# EAGLE design source_eagle (EAGLE 9.6.2)
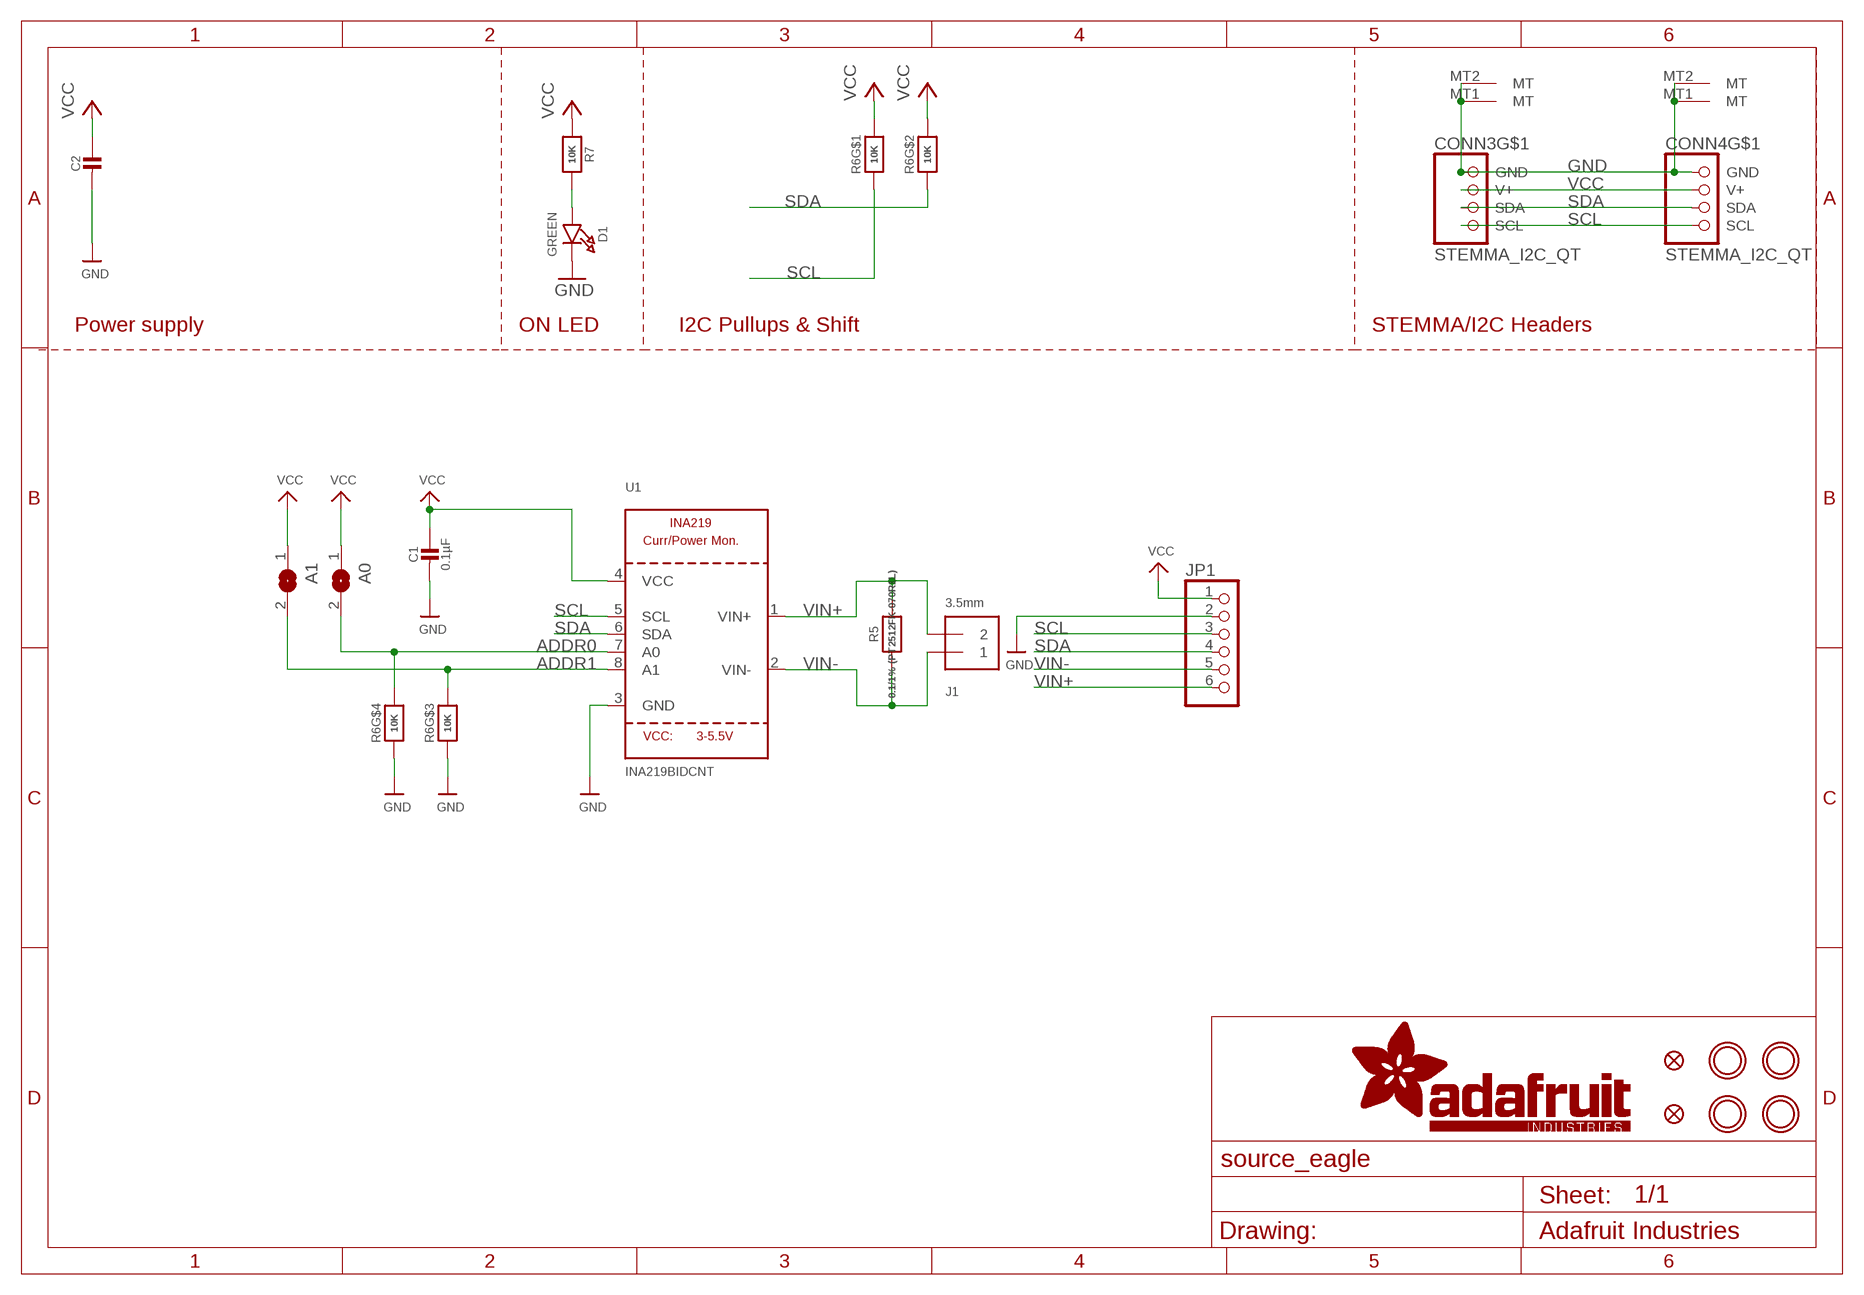
[diagram p0: schematic, sheet 1]

## Parts
A0  SOLDERJUMPERREFLOW_NOPASTE  [SOLDERJUMPER_REFLOW_NOPASTE]
A1  SOLDERJUMPERREFLOW_NOPASTE  [SOLDERJUMPER_REFLOW_NOPASTE]
C1  0.1µF  CAP_CERAMIC0603_NO  [0603-NO]
C2  10uF  CAP_CERAMIC0805-NOOUTLINE  [0805-NO]
CONN3  STEMMA_I2C_QT  [JST_SH4]
CONN4  STEMMA_I2C_QT  [JST_SH4]
D1  GREEN  LED0603_NOOUTLINE  [CHIPLED_0603_NOOUTLINE]
FID3  FIDUCIAL_1MM  [FIDUCIAL_1MM]
FID4  FIDUCIAL_1MM  [FIDUCIAL_1MM]
J1  3.5mm  TERMBLOCK_1X2_3.5MM  [TERMBLOCK_1X2-3.5MM]
JP1  HEADER-1X670MIL  [1X06_ROUND_70]
R5  0.1/1% (PT2512FK-070R1L)  RESISTOR2512  [2512]
R6  10K  RESISTOR_4PACK  [RESPACK_4X0603]
R7  10K  RESISTOR_0603_NOOUT  [0603-NO]
U1  INA219BIDCNT  INA219  [SOT23-8]
U$20  MOUNTINGHOLE2.5  [MOUNTINGHOLE_2.5_PLATED]
U$21  MOUNTINGHOLE2.5  [MOUNTINGHOLE_2.5_PLATED]
U$25  MOUNTINGHOLE2.5  [MOUNTINGHOLE_2.5_PLATED]
U$27  MOUNTINGHOLE2.5  [MOUNTINGHOLE_2.5_PLATED]

## Nets
ADDR0: A0.2 R6.5 U1.7(A0)
ADDR1: A1.2 R6.6 U1.8(A1)
GND: C1.2 C2.2 CONN3.1(GND) CONN3.MT1(MT) CONN3.MT2(MT) CONN4.1(GND) CONN4.MT1(MT) CONN4.MT2(MT) D1.C JP1.2 R6.3 R6.4 U1.3(GND)
N$3: D1.A R7.2
SCL: CONN3.4(SCL) CONN4.4(SCL) JP1.3 R6.1 U1.5(SCL)
SDA: CONN3.3(SDA) CONN4.3(SDA) JP1.4 R6.2 U1.6(SDA)
VCC: A0.1 A1.1 C1.1 C2.1 CONN3.2(V+) CONN4.2(V+) JP1.1 R6.7 R6.8 R7.1 U1.4(VCC)
VIN+: J1.2 JP1.6 R5.2 U1.1(VIN+)
VIN-: J1.1 JP1.5 R5.1 U1.2(VIN-)

## Notes on the sheet
- Power supply | ON LED | I2C Pullups & Shift | STEMMA/I2C Headers

## Library data of the parts
A0 A1 = microbuilder:SOLDERJUMPER: SMD Solder JUMPER Solder the two pads together to create a connection, or remove the solder to break it. REFLOW - Use this footprint for solder paste and reflow ovens. WAVE - Use this footprint for hand-soldering (larger pads). CLOSED - Has a trace between the two pads to ensure it is closed by default. The trace needs to be cut to disable the jumper, and can be closed again by creating a solder bridge between the two pads.
C1 C2 = microbuilder:CAP_CERAMIC: Ceramic Capacitors For new designs, use the packages preceded by an '_' character since they are more reliable: The following footprints should be used on most boards: _0402 - Standard footprint for regular board layouts _0603 - Standard footprint for regular board layouts _0805 - Standard footprint for regular board layouts _1206 - Standard footprint for regular board layouts For extremely tight-pitch boards where space is at a premium, the following 'micro-pitch' footprints can be used (smaller pads, no silkscreen outline, etc.): _0402MP - Micro-pitch footprint for very dense/compact boards _0603MP - Micro-pitch footprint for very dense/compact boards _0805MP - Micro-pitch footprint for very dense/compact boards _1206MP - Micro-pitch footprint for very dense/compact boards
CONN3 CONN4 = microbuilder:STEMMA_I2C
D1 = microbuilder:LED: LED 0603 - 0603 Surface Mount Package 2mA: Green LED - Low Power (3.9mcd, 2ma, 1.7Vf) - Digikey: 475-2709-2-ND Orange LED - Low Power (9.8mcd, 2ma, 1.8Vf) - Digikey: 475-1194-2-ND Red LED - Low Power (5mcd, 2ma, 1.8Vf) - Digikey: 475-1195-2-ND Yellow LED - Low Power (7mcd, 2ma, 1.8Vf) - Digikey: 475-1196-2-ND 5mA: Blue LED - Low Power (17mcd, 5ma, 2.9Vf) - Digikey: LNJ937W8CRACT-ND 0805 - 0805 Surface Mount Package 2mA: Red LED (8.8mcd, 2mA, 1.8Vf, Clear) - Low Power [Digikey: 475-2510-1-ND] Green LED (5mcd, 2mA, 1.8Vf, Clear) - Low Power [Digikey: 475-2730-1-ND] Yellow LED (11.3mcd, 2mA, 1.8Vf, Clear) - Low Power [Digikey: 475-2555-1-ND] 20mA: Red LED (104mcd, 20mA, Diffused) - LS R976 [Digikey: 475-1278-6-ND] Red LED (12mcd, 20mA, 2.0Vf, Clear) - APT2012EC [Digikey: 754-1128-1-ND] Green LED (15mcd, 20mA, 2.2Vf, Clear) - APT2012GC [Digikey: 754-1131-1-ND] Orange LED (160mcd, 20mA, 2.1Vf, Clear) - APT2012SECK [Digikey: 754-1130-1-ND] 1206 - 1206 Surface Mount Package Green LED (26mcd, 20mA, Diffused) - LG N971 [Digikey: 475-1407-6-ND] Red LED (15mcd, 20mA, Diffused) - LH N974 [Digikey: 475-1416-6-ND] Cree - Cree High-Power Surface Mount LEDs XPEBWT-L1-0000-00D50 - White 111lm 350mA 2.9Vf 6200K 110° XTEAWT-00-0000-00000LEE3 - White 114lm 350mA 2.85Vf 5000K 115° Everlight - Everlight 45-21 Series Surface Mount LEDs 45-21/QK2C-B2832AC2CB2/2T - Warm White 2000mcd 20mA 3.25Vf 3050K 120° 45-21/LK2C-B38452C4CB2/2T - Nuetral White 2000mcd 20mA 3.25Vf 4150K 120° 45-21/LK2C-B50634C6CB2/2T - Cold White 2200mcd 20mA 3.25Vf 5650K 120° PLCC2 Reverse Mount LS T77K-J1L2-1-0-2-R18-Z - Red 11.25mcd 2mA 1.8Vf 630nm 120° LO T77K-L1M2-24-Z - Orange 19.6mcd 2mA 1.8Vf 606nm 120° LY T77K-K2M1-26-Z - Yellow 15.7mcd 2mA 1.8Vf 587nm 120°
FID3 FID4 = microbuilder:FIDUCIAL: Fiducial Alignment Points Various fiducial points for machine vision alignment.; BOM: EXCLUDE
J1 = microbuilder:TERMBLOCK_1X2: 3.5mm Terminal block http://www.ladyada.net/library/pcb/eaglelibrary.html
JP1 = microbuilder:HEADER-1X6: PIN HEADER
R5 R7 = microbuilder:RESISTOR: Resistors For new designs, use the packages preceded by an '_' character since they are more reliable: The following footprints should be used on most boards: _0402 - Standard footprint for regular board layouts _0603 - Standard footprint for regular board layouts _0805 - Standard footprint for regular board layouts _1206 - Standard footprint for regular board layouts For extremely tight-pitch boards where space is at a premium, the following 'micro-pitch' footprints can be used (smaller pads, no silkscreen outline, etc.): _0402MP - Micro-pitch footprint for very dense/compact boards _0603MP - Micro-pitch footprint for very dense/compact boards _0805MP - Micro-pitch footprint for very dense/compact boards _1206MP - Micro-pitch footprint for very dense/compact boards
R6 = microbuilder:RESISTOR_4PACK: Resistor Packs (4 resistors) 4 x 0603 10K 1/16W - Digikey: YC164J-10KCT-ND
U1 = microbuilder:INA219: INA219 - I2C Current/Power Monitor Voltage Range: 0-26V Accuracy: 0.5% Temperature: -40°C - 125°C
U$20 U$21 U$25 U$27 = microbuilder:MOUNTINGHOLE: Mounting Hole For #2 screws (0.086"/2.18mm width, 0.094"/2.4mm hole) use 2.5mm; BOM: EXCLUDE

## Net classes
1 highpower: width 0.305 mm, drill 0.483 mm
2 lowpower: width 0.254 mm, drill 0.483 mm

## Board
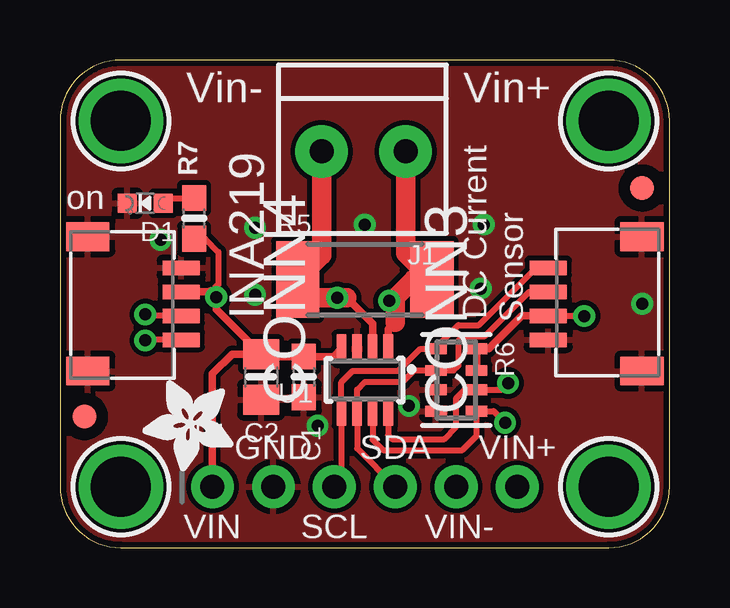
[diagram p1: board, top side]
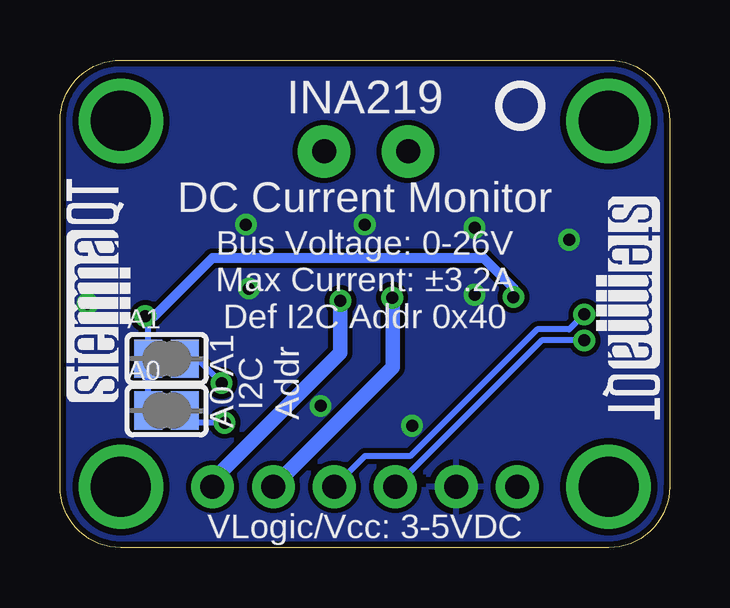
[diagram p2: board, bottom side, seen from below]

Size 25.4 x 20.32 mm. Coordinates in mm from the lower left corner, seen from the top.
Outline: 0,17.78 0,2.54 arc90 2.54,0 22.86,0 arc90 25.4,2.54 25.4,17.78 arc90 22.86,20.32 2.54,20.32 arc90 0,17.78
Copper layers (1*16): Top 0.035mm / dielectric 1.5mm / Bottom 0.035mm
Design rules "adafruit 7-7": minimum track width 6mil, minimum drill 15.5mil, track to track 8mil, track to pad 7mil, pad to pad 7mil, via to via 7mil, smd to smd 7mil, copper to edge 10mil, drill to drill 8mil, minimum pad ring 10mil, minimum via ring 8mil, stop-mask expansion 2mil, vias tented up to drill 20mil, thermal gap 10mil
bRestrict: area 10.2,2.5 to 10.3,3

### Footprints (pad centres in the part's own frame; a part is rotated, then mirrored left to right if it is on the bottom)
SOLDERJUMPER_REFLOW_NOPASTE = smd 1.168 x 1.6: 1 -0.762,0; 2 0.762,0
0603-NO = smd 1.075 x 1: 1 -0.85,0; 2 0.85,0
0805-NO = smd 1.24 x 1.5: 1 -0.95,0; 2 0.95,0
JST_SH4 = smd 0.6 x 1.55: 1 -1.5,2.514; 2 -0.5,2.514; 3 0.5,2.514; 4 1.5,2.514 | smd 1.2 x 1.8: MT1 -2.8,-1.386; MT2 2.8,-1.386
CHIPLED_0603_NOOUTLINE = smd 0.8 x 0.8: A 0,-0.75; C 0,0.75
FIDUCIAL_1MM = smd 1 x 1: 1 0,0
TERMBLOCK_1X2-3.5MM = drill 1 pad 2.184: 1 1.8,0; 2 -1.7,0
1X06_ROUND_70 = drill 1 pad 1.778: 1 -6.35,0; 2 -3.81,0; 3 -1.27,0; 4 1.27,0; 5 3.81,0; 6 6.35,0
2512 = smd 1.8 x 3.2: 1 -2.8,0; 2 2.8,0
RESPACK_4X0603 = smd 0.45 x 0.9: 1 -1.3,-0.85; 2 -0.4,-0.85; 3 0.4,-0.85; 4 1.3,-0.85; 5 1.3,0.85; 6 0.4,0.85; 7 -0.4,0.85; 8 -1.3,0.85
SOT23-8 = smd 0.4 x 1.2: 1 -0.975,-1.3; 2 -0.325,-1.3; 3 0.325,-1.3; 4 0.975,-1.3; 5 0.975,1.3; 6 0.325,1.3; 7 -0.325,1.3; 8 -0.975,1.3
MOUNTINGHOLE_2.5_PLATED = drill 2.5 pad 3.2: P$1 0,0

### Placement (x,y rotation side)
A0  20.95,5.71 0 bottom
A1  20.95,7.87 0 bottom
C1  10.16,7.11 270 top
C2  8.38,7.11 270 top
CONN3  22.86,10.16 90 top
CONN4  2.54,10.16 270 top
D1  3.56,14.35 90 top
FID3  1.02,5.46 0 top
FID4  24.26,14.99 0 top
J1  12.7,16.51 180 top
JP1  12.7,2.54 0 top
R5  12.7,11.18 0 top
R6  16.51,6.99 270 top
R7  5.59,13.72 90 top
U1  12.7,6.99 180 top
U$20  2.54,17.78 0 top
U$21  22.86,17.78 0 top
U$25  2.54,2.54 0 top
U$27  22.86,2.54 0 top
U$29  [ADAFRUIT_3.5MM]  7.24,6.99 180 top
U$30  [PCBFEAT-REV-040]  6.22,18.41 0 bottom
U$31  [STEMMAQT]  22.48,6.1 90 bottom
U$32  [STEMMAQT]  3.05,14.61 270 bottom

### Tracks (layer width: path | path; a pad name or v marks a point on that pad's centre or on a via)
ADDR0  (via drill 0.5)
  Top 0.254: U1.7 13.03,4.5 13.46,4.06 16.76,4.06 17.36,4.66 R6.5 18.06,5.68 v18.54,5.21
  Bottom 0.254: A0.2 19.68,5.21 v18.54,5.21
ADDR1  (via drill 0.5)
  Top 0.254: U1.8 13.68,4.69 13.84,4.52 16,4.52 16.51,5.03 16.51,6.22 16.87,6.58 R6.6 18.4,6.58 v18.67,6.86
  Bottom 0.254: v18.67,6.86 19.68,7.87 A1.2
GND  (via drill 0.5)
  other vias: 10.73,5.08 24.26,10.16 4.19,12.83 8.13,10.54 8.13,13.34 12.7,13.46 17.65,13.46 17.53,10.79 14.54,5.91
  pour Top: 0,20.32 25.4,20.32 25.4,0 0,0
  pour Bottom: 0,20.32 25.4,20.32 25.4,0 0,0
N$3
  Top 0.254: D1.A 4.52,14.57 R7.2
SCL  (via drill 0.5)
  Top 0.254: JP1.3 11.72,2.83 U1.5 11.72,6.9 12.19,7.37 14.1,7.37 15.02,8.29 R6.1 15.66,8.34 16.59,9.27 17.45,9.27 19.84,11.66 CONN3.4 | CONN4.4 3.58,8.66 v3.56,8.64
  Bottom 0.254: v3.56,8.64 5.33,8.64 JP1.3
SDA  (via drill 0.5)
  Top 0.254: JP1.4 12.38,4.13 U1.6 12.38,6.58 12.7,6.91 14.29,6.91 14.76,7.38 R6.2 16.4,7.38 16.61,7.59 16.61,8.64 16.78,8.81 17.7,8.81 19.55,10.66 CONN3.3 | CONN4.3 3.62,9.66 v3.56,9.72
  Bottom 0.254: v3.56,9.72 4.18,9.09 5.52,9.09 10.81,3.81 12.7,3.81 JP1.4
VCC  (via drill 0.5)
  Top 0.254: R7.1 6.06,12.87 6.6,12.32 6.6,10.97 6.29,10.66 | v21.84,9.65 CONN3.2
  Top 0.305: U1.4 11.4,7.96 C1.1 8.48,7.96 C2.1 | CONN4.2 6.29,10.66 | C2.1 6.51,9.94 v6.51,10.44 | R6.7 R6.8 17.86,8.29 19.23,9.66 CONN3.2 | JP1.1 6.35,7.24 7.17,8.06 C2.1
  Top 0.406: 6.29,10.66 v6.51,10.44
  Bottom 0.254: A0.1 A1.1 21.72,9.53 v21.84,9.65
  Bottom 0.406: v6.51,10.44 6.51,10.82 7.75,12.06 19.05,12.06 21.46,9.65 v21.84,9.65
VIN+  (via drill 0.5)
  Top 0.305: U1.1 13.68,9.1 13.97,9.4
  Top 0.61: 13.97,10.16 13.84,10.16 v13.72,10.29 13.84,10.29
  Top 0.813: J1.2 14.4,12.28 R5.2 14.73,11.18 13.84,10.29 | 13.97,9.4 13.97,10.16
  Bottom 0.61: JP1.6 19.05,2.79 13.72,8.13 v13.72,10.29
VIN-  (via drill 0.5)
  Top 0.305: U1.2 13.03,9.33 11.94,10.41
  Top 0.813: J1.1 10.9,12.18 R5.1 9.9,10.55 10.03,10.41 v11.56,10.41 11.94,10.41
  Bottom 0.61: JP1.5 11.54,7.51 11.54,10.39 v11.56,10.41

### Text on the board
tPlace: Vin- | Vin+ | on | INA219 | DC Current | Sensor | GND | SDA | VIN+ | VIN | SCL | VIN-
bPlace: INA219 | DC Current Monitor | Bus Voltage: 0-26V / Max Current: ±3.2A / Def I2C Addr 0x40 | A1 | I2C / Addr | A0 | VLogic/Vcc: 3-5VDC